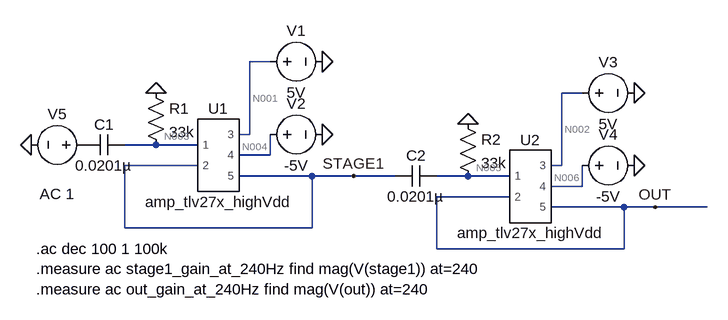
[diagram p0: schematic Exercise-8-4_cascaded-rc-high-pass-filter.asc]
Exercise-8-4_cascaded-rc-high-pass-filter.asc, the LTspice schematic file:
Version 4.1
SHEET 1 932 680
WIRE 192 48 160 48
WIRE 672 96 640 96
WIRE 160 160 160 48
WIRE 160 160 144 160
WIRE 16 176 -32 176
WIRE 80 176 16 176
WIRE 192 192 192 160
WIRE 192 192 144 192
WIRE 80 208 -32 208
WIRE 640 208 640 96
WIRE 640 208 624 208
WIRE 256 224 144 224
WIRE 320 224 256 224
WIRE 384 224 320 224
WIRE 496 224 448 224
WIRE 560 224 496 224
WIRE 672 240 672 208
WIRE 672 240 624 240
WIRE 560 256 448 256
WIRE 736 272 624 272
WIRE 784 272 736 272
WIRE 864 272 784 272
WIRE -32 304 -32 208
WIRE 256 304 256 224
WIRE 256 304 -32 304
WIRE 448 336 448 256
WIRE 736 336 736 272
WIRE 736 336 448 336
FLAG 16 96 0
FLAG 272 48 0
FLAG 272 160 0
FLAG 496 144 0
FLAG 752 96 0
FLAG 752 208 0
FLAG 784 272 OUT
FLAG -176 176 0
FLAG 320 224 STAGE1
SYMBOL EEL3111C\\amp_tlv27x_highVdd 112 192 R0
SYMATTR InstName U1
SYMBOL voltage 176 48 R270
WINDOW 0 32 56 VTop 2
WINDOW 3 -32 56 VBottom 2
WINDOW 123 0 0 Left 0
WINDOW 39 0 0 Left 0
SYMATTR InstName V1
SYMATTR Value 5V
SYMBOL voltage 176 160 R270
WINDOW 0 32 56 VTop 2
WINDOW 3 -32 56 VBottom 2
WINDOW 123 0 0 Left 0
WINDOW 39 0 0 Left 0
SYMATTR InstName V2
SYMATTR Value -5V
SYMBOL cap -32 160 R90
WINDOW 0 0 32 VBottom 2
WINDOW 3 32 32 VTop 2
SYMATTR InstName C1
SYMATTR Value 0.0201µ
SYMBOL res 0 80 R0
SYMATTR InstName R1
SYMATTR Value 33k
SYMBOL EEL3111C\\amp_tlv27x_highVdd 592 240 R0
SYMATTR InstName U2
SYMBOL voltage 656 96 R270
WINDOW 0 32 56 VTop 2
WINDOW 3 -32 56 VBottom 2
WINDOW 123 0 0 Left 0
WINDOW 39 0 0 Left 0
SYMATTR InstName V3
SYMATTR Value 5V
SYMBOL voltage 656 208 R270
WINDOW 0 32 56 VTop 2
WINDOW 3 -32 56 VBottom 2
WINDOW 123 0 0 Left 0
WINDOW 39 0 0 Left 0
SYMATTR InstName V4
SYMATTR Value -5V
SYMBOL cap 448 208 R90
WINDOW 0 0 32 VBottom 2
WINDOW 3 32 32 VTop 2
SYMATTR InstName C2
SYMATTR Value 0.0201µ
SYMBOL res 480 128 R0
SYMATTR InstName R2
SYMATTR Value 33k
SYMBOL voltage -80 176 R90
WINDOW 0 -32 56 VBottom 2
WINDOW 3 32 56 VTop 2
WINDOW 123 60 56 VTop 2
WINDOW 39 0 0 Left 0
SYMATTR InstName V5
SYMATTR Value ""
SYMATTR Value2 AC 1
TEXT -168 336 Left 2 !.ac dec 100 1 100k\n.measure ac stage1_gain_at_240Hz find mag(V(stage1)) at=240\n.measure ac out_gain_at_240Hz find mag(V(out)) at=240

The netlist it stands for:
* Exercise-8-4_cascaded-rc-high-pass-filter.asc
X§U1 N003 STAGE1 N001 N004 STAGE1 amp_tlv27x_highVdd  ; pins 1 2 3 4 5
V1 N001 0 5V
V2 N004 0 -5V
C1 N003 P001 0.0201µ
R1 0 N003 33k
X§U2 N005 OUT N002 N006 OUT amp_tlv27x_highVdd  ; pins 1 2 3 4 5
V3 N002 0 5V
V4 N006 0 -5V
C2 N005 STAGE1 0.0201µ
R2 0 N005 33k
V5 P001 0 AC 1
.ac dec 100 1 100k
.measure ac stage1_gain_at_240Hz find mag(V(stage1)) at=240
.measure ac out_gain_at_240Hz find mag(V(out)) at=240
.lib TLV271.LIB
.backanno
.end

* Results of the author's LTspice run, read from the files saved beside the schematic
* Operating Point, zero values left out:
*   V(n001) = 5 V
*   V(n002) = 5 V
*   V(n003) = 227.7 nV
*   V(n004) = -5 V
*   V(n005) = 227.7 nV
*   V(n006) = -5 V
*   V(out) = -280.2 µV
*   V(stage1) = -280.2 µV
*   I(R1) = -6.9 pA
*   I(R2) = -6.9 pA
*   I(V1) = -67.78 µA
*   I(V2) = 67.78 µA
*   I(V3) = -67.78 µA
*   I(V4) = 67.78 µA
*   Ix(u1:1) = -6.9 pA
*   Ix(u1:2) = -6.901 pA
*   Ix(u1:3) = 67.78 µA
*   Ix(u1:4) = -67.78 µA
*   Ix(u1:5) = 7.131 pA
*   Ix(u2:1) = -6.9 pA
*   Ix(u2:2) = -6.901 pA
*   Ix(u2:3) = 67.78 µA
*   Ix(u2:4) = -67.78 µA
*   Ix(u2:5) = 7.131 pA
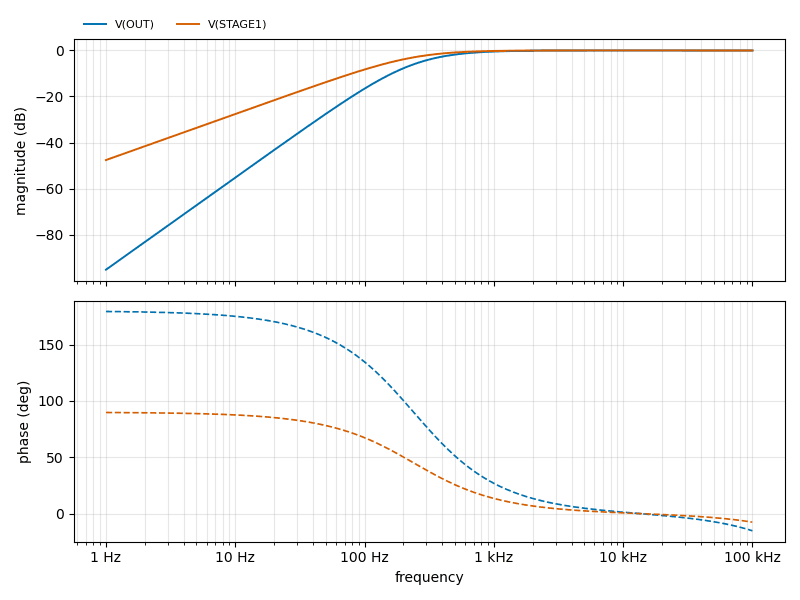
[diagram p1: AC Analysis of Exercise-8-4_cascaded-rc-high-pass-filter.asc, plotted from the saved traces]
* AC Analysis, 1 run:
*   V(OUT): -95.21 dB at 1 Hz, -0.08 dB at 100 kHz, peak -0.01 dB at 15.85 kHz, 3 dB below the peak at 372.5 Hz
*   V(STAGE1): -47.61 dB at 1 Hz, -0.04 dB at 100 kHz, peak -0.00 dB at 15.85 kHz, 3 dB below the peak at 239.8 Hz
* From the log:
*   stage1_gain_at_240hz: mag(V(stage1)) =(-3.01213096089dB,0°) at 240
*   out_gain_at_240hz: mag(V(out)) =(-6.02426335613dB,0°) at 240